# Altium schematic sheet Controller_Section.SchDoc
size A4; SheetNumber: 4
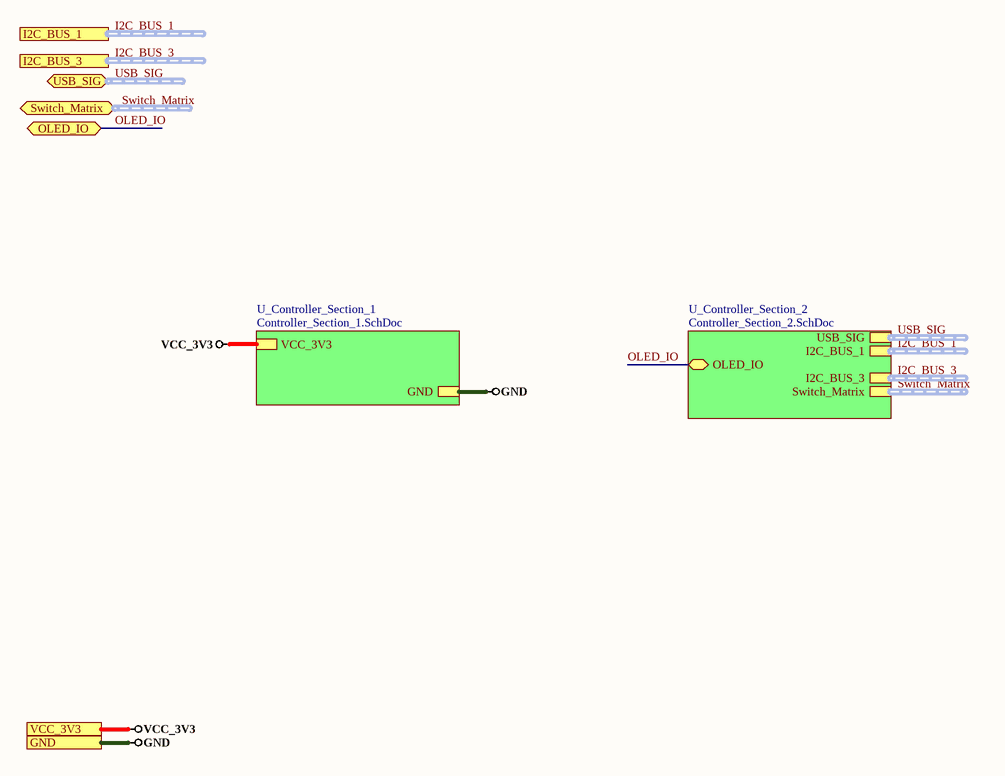
[diagram p0: Controller_Section.SchDoc]

## Sub-sheets
U_Controller_Section_1 = Controller_Section_1.SchDoc: VCC_3V3, GND
U_Controller_Section_2 = Controller_Section_2.SchDoc: USB_SIG (harness USB_SIG), I2C_BUS_1 (harness I2C_BUS_1), I2C_BUS_3 (harness I2C_BUS_3), Switch_Matrix (harness Switch_Matrix), OLED_IO (bidir)

## Ports
GND, I2C_BUS_1 (harness I2C_BUS_1), I2C_BUS_3 (harness I2C_BUS_3), OLED_IO (bidir), Switch_Matrix (bidir, harness Switch_Matrix), USB_SIG (bidir, harness USB_SIG), VCC_3V3

## Nets
GND: port GND, sheet U_Controller_Section_1/GND
VCC_3V3: port VCC_3V3, sheet U_Controller_Section_1/VCC_3V3
OLED_IO: port OLED_IO, sheet U_Controller_Section_2/OLED_IO

## Buses and harness runs
harness I2C_BUS_1 = port I2C_BUS_1
harness I2C_BUS_1 = sheet U_Controller_Section_2/I2C_BUS_1
harness I2C_BUS_3 = port I2C_BUS_3
harness I2C_BUS_3 = sheet U_Controller_Section_2/I2C_BUS_3
harness Switch_Matrix = port Switch_Matrix
harness Switch_Matrix = sheet U_Controller_Section_2/Switch_Matrix
harness USB_SIG = port USB_SIG
harness USB_SIG = sheet U_Controller_Section_2/USB_SIG